# Altium schematic sheet 蓝牙.schdoc
size 297 x 209 mm; Symbol: Drawing-Symbol_A4; @Create Time: 11:19:45; @Update Time: 16:56:06; Border: 1; Width: 1170; Height: 825; Region Start: 1; X Region Count: 6; Y Region Count: 4; Blade Width: 10; Title Block Position: 3; Title Block: 1; @Board Name: Board1; Company: 嘉立创EDA; Version: V1.0; Page Size: A4; @Project Name: stm32f4; @Page Count: 3; @Update Date: 2025-11-07; @Create Date: 2025-10-30; @Schematic Name: Schematic1; @Page No: 3; @Page Name: 蓝牙; Device: Drawing-Symbol_A4
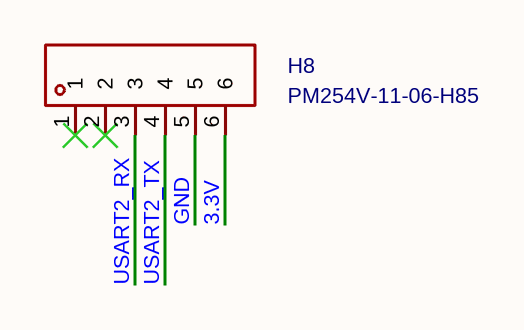
[diagram p0: 蓝牙.schdoc]

## Parts
H8  PM254V-11-06-H85  [HDR-TH_6P-P2.54-V-F]

## Nets
3.3V: H8.6
GND: H8.5
USART2_RX: H8.3
USART2_TX: H8.4

Not connected (* = marked no-connect by the designer): H8 1* 2*

## Notes on the sheet
- 创建日期
- 2025-10-30
- 原理图
- 板子
- Schematic1
- Board1
- 更新日期
- 图页
- 2025-11-07
- 蓝牙
- 绘制
- 审阅
- stm32f4
- 版本
- V1.0
- 尺寸
- A4
- 页    3    共    3
- 嘉立创EDA

## Library data of the parts
H8 = PM254V-11-06-H85: 插孔结构:1x6P;间距:2.54mm;行距:-;圆孔/方孔:方孔;安装方式:直插;排数:单排;总孔位数:6P;额定电流:3A;额定电压:250V;插孔方向:顶部;塑高:-;工作温度:-40℃~+105℃;; Manufacturer: XFCN(兴飞); AddInBom: yes; ModelId: 0f5bcf94dcda47d085f24cdca1696fe9; ModelTransform: 619.684,94.488,0,0,0,0,0,0,-125.984; Holes Structure: 1x6P; Pitch: 2.54mm; Circular Hole / Square Hole: 方孔; Number of Positions: 6P; Current Rating: 3A; Voltage Rating (Max): 250V; Holes Direction: 顶部; Symbol: PM254V-11-06-H85; Device: PM254V-11-06-H85; LCSC Part Name: 间距:2.54mm 1x6P 直插; SupplierPart: C2832269; ManufacturerPart: PM254V-11-06-H85; Supplier Footprint: 插件,P=2.54mm; JLCPCB Part Class: 扩展库; Datasheet: https://item.szlcsc.com/datasheet/PM254V-11-06-H85/2989787.html; Supplier: LCSC; ConvertToPcb: yes; FootprintName: HDR-TH_6P-P2.54-V-F; ModelName: HDR-TH_6P-P2.54-V-F; Row Spacing: -; Mounting Type: 直插; Number of Rows: 单排; Insulation Height: -; Operating Temperature: -40℃~+105℃